# EAGLE design radio-v3.0 (EAGLE 9.2.2)
REVISION: 3.0; SCH_DESC: Dual ISM43340 5GHz radio transciever.; TEAM: RoboCup SSL
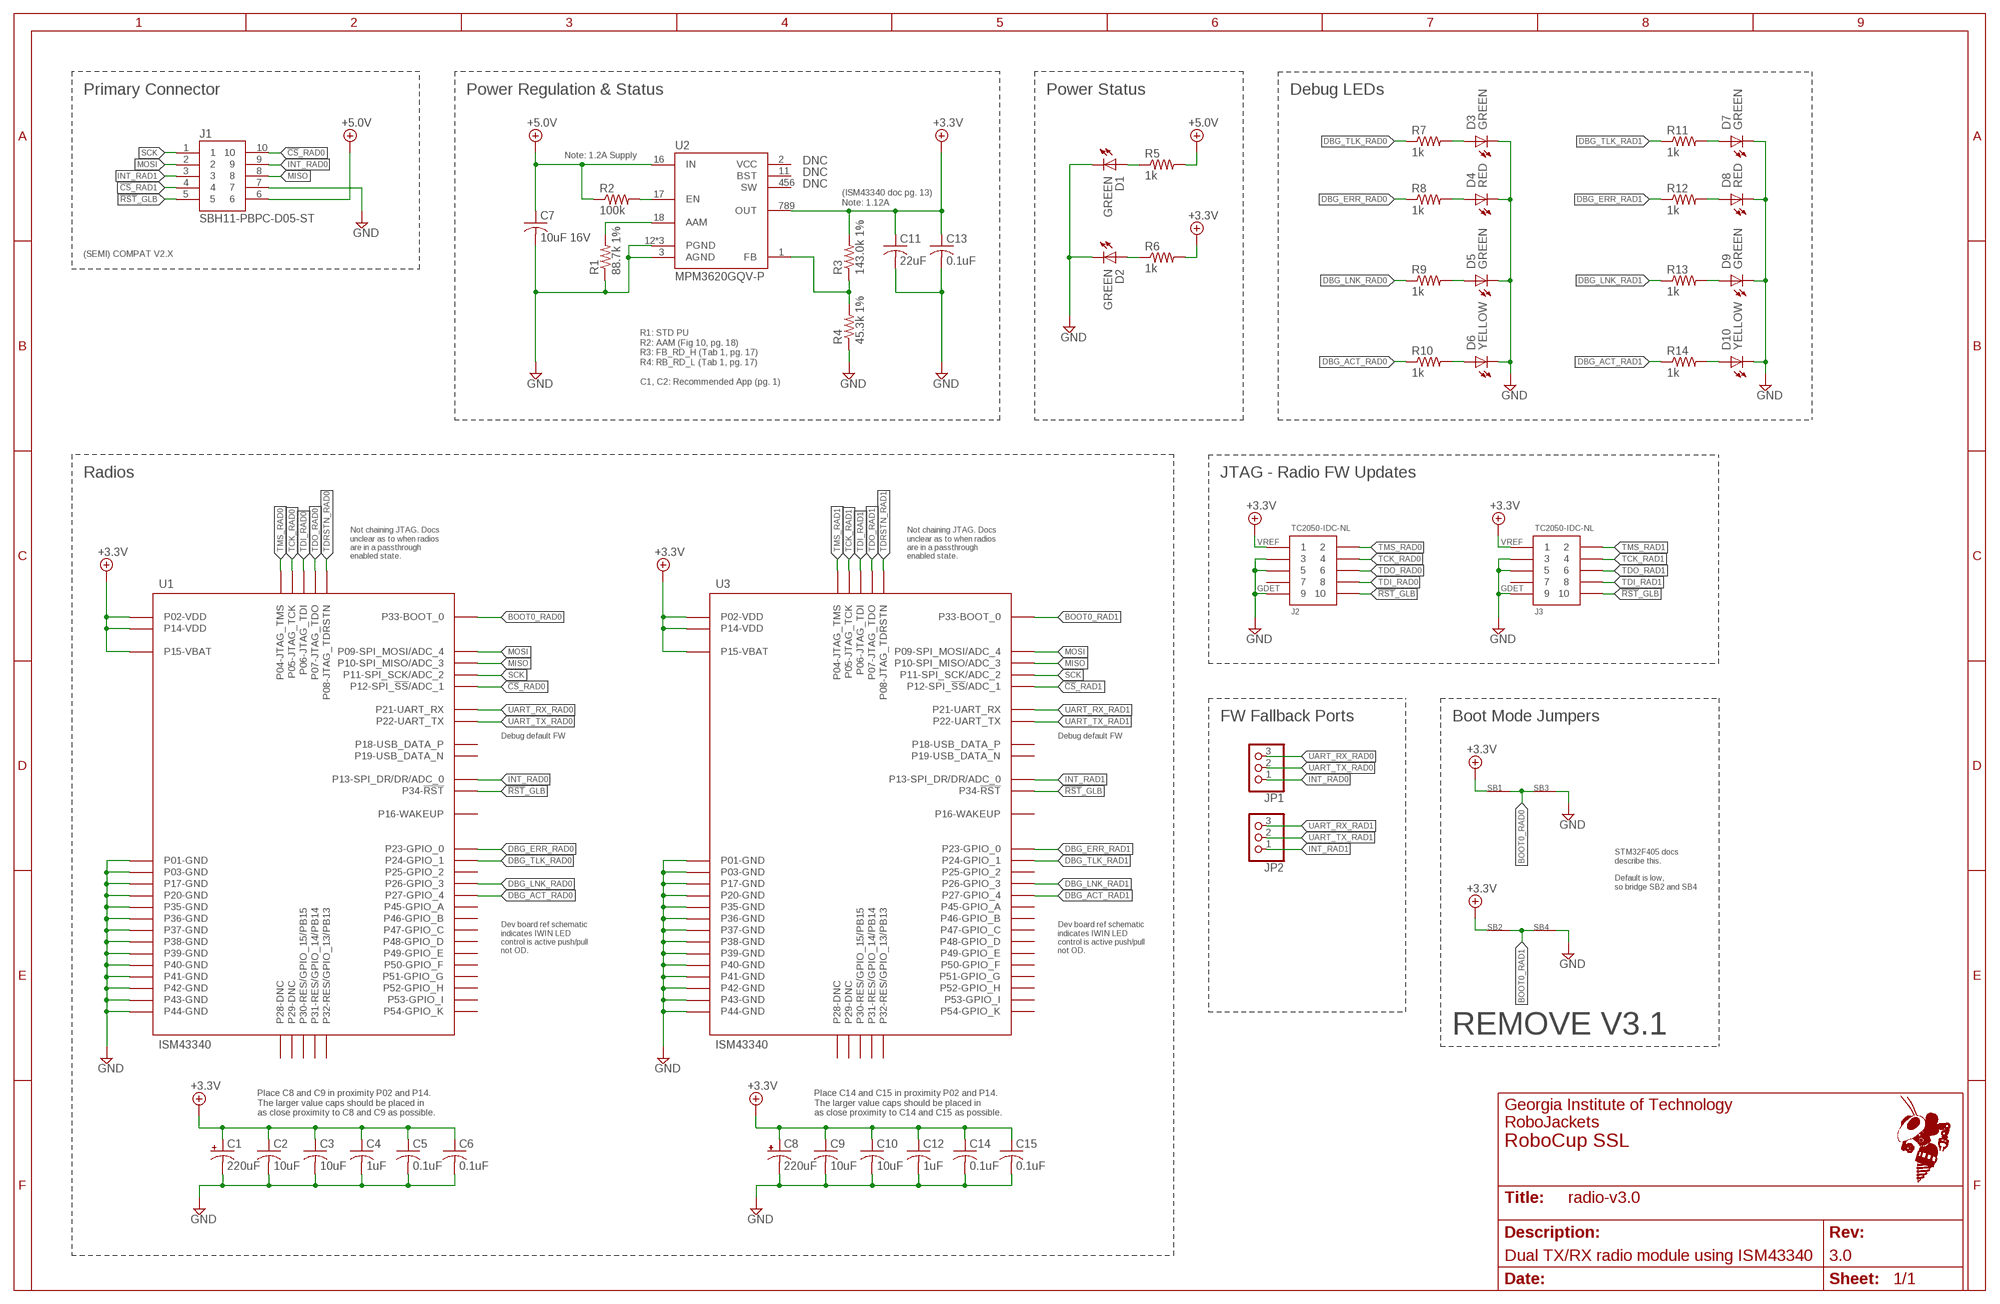
[diagram p0: schematic, sheet 1]
FRAME1 (FRAME_B_L): SCH_DESC: Dual TX/RX radio module using ISM43340

## Parts
C1  220uF  ECA-0JM221  [ECA-0JM221-HGT_HORIZ]
C2  10uF  C-USC1210  [C1210]
C3  10uF  C-USC1210  [C1210]
C4  1uF  C-USC0603  [C0603]
C5  0.1uF  C-USC0603  [C0603]
C6  0.1uF  C-USC0603  [C0603]
C7  10uF 16V  C-USC1210  [C1210]
C8  220uF  ECA-0JM221  [ECA-0JM221-HGT_HORIZ]
C9  10uF  C-USC1210  [C1210]
C10  10uF  C-USC1210  [C1210]
C11  22uF  C-USC1210  [C1210]
C12  1uF  C-USC0603  [C0603]
C13  0.1uF  C-USC0603  [C0603]
C14  0.1uF  C-USC0603  [C0603]
C15  0.1uF  C-USC0603  [C0603]
D1  GREEN  LED-SMD-GREEN  [CHIP-LED0603]
D2  GREEN  LED-SMD-GREEN  [CHIP-LED0603]
D3  GREEN  LED-SMD-GREEN  [CHIP-LED0603]
D4  RED  LED-SMD-RED  [CHIP-LED0603]
D5  GREEN  LED-SMD-GREEN  [CHIP-LED0603]
D6  YELLOW  LED-SMD-YELLOW  [CHIP-LED0603]
D7  GREEN  LED-SMD-GREEN  [CHIP-LED0603]
D8  RED  LED-SMD-RED  [CHIP-LED0603]
D9  GREEN  LED-SMD-GREEN  [CHIP-LED0603]
D10  YELLOW  LED-SMD-YELLOW  [CHIP-LED0603]
J1  SBH11-PBPC-D05-ST  [SFH11-*-D05-ST]
J2  TC2050-IDC-NL  [TC2050-IDC-NL]
J3  TC2050-IDC-NL  [TC2050-IDC-NL]
JP1  PINHD-1X3  [1X03]
JP2  PINHD-1X3  [1X03]
R1  88.7k 1%  R-US_R0603  [R0603]
R2  100k  R-US_R0603  [R0603]
R3  143.0k 1%  R-US_R0603  [R0603]
R4  45.3k 1%  R-US_R0603  [R0603]
R5  1k  R-US_R0603  [R0603]
R6  1k  R-US_R0603  [R0603]
R7  1k  R-US_R0603  [R0603]
R8  1k  R-US_R0603  [R0603]
R9  1k  R-US_R0603  [R0603]
R10  1k  R-US_R0603  [R0603]
R11  1k  R-US_R0603  [R0603]
R12  1k  R-US_R0603  [R0603]
R13  1k  R-US_R0603  [R0603]
R14  1k  R-US_R0603  [R0603]
SB1  SOLDERBRIDGESB0603  [SB0603]
SB2  SOLDERBRIDGESB0603  [SB0603]
SB3  SOLDERBRIDGESB0603  [SB0603]
SB4  SOLDERBRIDGESB0603  [SB0603]
U1  ISM43340  [ISM43340]
U2  MPM3620GQV-P  [MPM3620GQV-P]
U3  ISM43340  [ISM43340]

## Nets
3V3_PWR_IND: D2.A R6.1
5V_PWR_IND: D1.A R5.1
!CS!_RAD0: J1.10 U1.P$12(P12-SPI_!SS!/ADC_1)
!CS!_RAD1: J1.4 U3.P$12(P12-SPI_!SS!/ADC_1)
!RST!_GLB: J1.5 J2.P$10 J3.P$10 U1.P$34(P34-!RST!) U3.P$34(P34-!RST!)
+3.3V: C1.P$1(+) C2.1 C3.1 C4.1 C5.1 C6.1 C8.P$1(+) C9.1 C10.1 C11.1 C12.1 C13.1 C14.1 C15.1 J2.P$1 J3.P$1 R3.2 R6.2 SB1.1 SB2.1 U1.P$2(P02-VDD) U1.P$14(P14-VDD) U1.P$15(P15-VBAT) U2.789(OUT) U3.P$2(P02-VDD) U3.P$14(P14-VDD) U3.P$15(P15-VBAT)
+5.0V: C7.1 J1.6 R2.1 R5.2 U2.16(IN)
AAM: R1.2 U2.18(AAM)
BOOT0_RAD0: SB1.2 SB3.1 U1.P$33(P33-BOOT_0)
BOOT0_RAD1: SB2.2 SB4.1 U3.P$33(P33-BOOT_0)
DBG_ACT_RAD0: R10.1 U1.P$27(P27-GPIO_4)
DBG_ACT_RAD1: R14.1 U3.P$27(P27-GPIO_4)
DBG_ERR_RAD0: R8.1 U1.P$23(P23-GPIO_0)
DBG_ERR_RAD1: R12.1 U3.P$23(P23-GPIO_0)
DBG_LNK_RAD0: R9.1 U1.P$26(P26-GPIO_3)
DBG_LNK_RAD1: R13.1 U3.P$26(P26-GPIO_3)
DBG_TLK_RAD0: R7.1 U1.P$24(P24-GPIO_1)
DBG_TLK_RAD1: R11.1 U3.P$24(P24-GPIO_1)
EN: R2.2 U2.17(EN)
FB: R3.1 R4.2 U2.1(FB)
GND: C1.P$2(-) C2.2 C3.2 C4.2 C5.2 C6.2 C7.2 C8.P$2(-) C9.2 C10.2 C11.2 C12.2 C13.2 C14.2 C15.2 D1.C(K) D2.C(K) D3.C(K) D4.C(K) D5.C(K) D6.C(K) D7.C(K) D8.C(K) D9.C(K) D10.C(K) J1.7 J2.P$3 J2.P$5 J2.P$9 J3.P$3 J3.P$5 J3.P$9 R1.1 R4.1 SB3.2 SB4.2 U1.P$1(P01-GND) U1.P$3(P03-GND) U1.P$17(P17-GND) U1.P$20(P20-GND) U1.P$35(P35-GND) U1.P$36(P36-GND) U1.P$37(P37-GND) U1.P$38(P38-GND) U1.P$39(P39-GND) U1.P$40(P40-GND) U1.P$41(P41-GND) U1.P$42(P42-GND) U1.P$43(P43-GND) U1.P$44(P44-GND) U2.3(AGND) U2.12(PGND) U2.13(PGND) U2.14(PGND) U3.P$1(P01-GND) U3.P$3(P03-GND) U3.P$17(P17-GND) U3.P$20(P20-GND) U3.P$35(P35-GND) U3.P$36(P36-GND) U3.P$37(P37-GND) U3.P$38(P38-GND) U3.P$39(P39-GND) U3.P$40(P40-GND) U3.P$41(P41-GND) U3.P$42(P42-GND) U3.P$43(P43-GND) U3.P$44(P44-GND)
INT_RAD0: J1.9 JP1.1 U1.P$13(P13-SPI_DR/DR/ADC_0)
INT_RAD1: J1.3 JP2.1 U3.P$13(P13-SPI_DR/DR/ADC_0)
MISO: J1.8 U1.P$10(P10-SPI_MISO/ADC_3) U3.P$10(P10-SPI_MISO/ADC_3)
MOSI: J1.2 U1.P$9(P09-SPI_MOSI/ADC_4) U3.P$9(P09-SPI_MOSI/ADC_4)
N$2: D10.A R14.2
N$3: D9.A R13.2
N$4: D8.A R12.2
N$5: D7.A R11.2
N$6: D3.A R7.2
N$7: D4.A R8.2
N$8: D5.A R9.2
N$9: D6.A R10.2
SCK: J1.1 U1.P$11(P11-SPI_SCK/ADC_2) U3.P$11(P11-SPI_SCK/ADC_2)
TCK_RAD0: J2.P$4 U1.P$5(P05-JTAG_TCK)
TCK_RAD1: J3.P$4 U3.P$5(P05-JTAG_TCK)
TDI_RAD0: J2.P$8 U1.P$6(P06-JTAG_TDI)
TDI_RAD1: J3.P$8 U3.P$6(P06-JTAG_TDI)
TDO_RAD0: J2.P$6 U1.P$7(P07-JTAG_TDO)
TDO_RAD1: J3.P$6 U3.P$7(P07-JTAG_TDO)
TDRSTN_RAD0: U1.P$8(P08-JTAG_TDRSTN)
TDRSTN_RAD1: U3.P$8(P08-JTAG_TDRSTN)
TMS_RAD0: J2.P$2 U1.P$4(P04-JTAG_TMS)
TMS_RAD1: J3.P$2 U3.P$4(P04-JTAG_TMS)
UART_RX_RAD0: JP1.3 U1.P$21(P21-UART_RX)
UART_RX_RAD1: JP2.3 U3.P$21(P21-UART_RX)
UART_TX_RAD0: JP1.2 U1.P$22(P22-UART_TX)
UART_TX_RAD1: JP2.2 U3.P$22(P22-UART_TX)
Unconnected: J2.P$7 J3.P$7 U1.P$16(P16-WAKEUP) U1.P$18(P18-USB_DATA_P) U1.P$19(P19-USB_DATA_N) U1.P$25(P25-GPIO_2) U1.P$28(P28-DNC) U1.P$29(P29-DNC) U1.P$30(P30-RES/GPIO_15/PB15) U1.P$31(P31-RES/GPIO_14/PB14) U1.P$32(P32-RES/GPIO_13/PB13) U1.P$45(P45-GPIO_A) U1.P$46(P46-GPIO_B) U1.P$47(P47-GPIO_C) U1.P$48(P48-GPIO_D) U1.P$49(P49-GPIO_E) U1.P$50(P50-GPIO_F) U1.P$51(P51-GPIO_G) U1.P$52(P52-GPIO_H) U1.P$53(P53-GPIO_I) U1.P$54(P54-GPIO_K) U2.2(VCC) U2.11(BST) U2.456(SW) U3.P$16(P16-WAKEUP) U3.P$18(P18-USB_DATA_P) U3.P$19(P19-USB_DATA_N) U3.P$25(P25-GPIO_2) U3.P$28(P28-DNC) U3.P$29(P29-DNC) U3.P$30(P30-RES/GPIO_15/PB15) U3.P$31(P31-RES/GPIO_14/PB14) U3.P$32(P32-RES/GPIO_13/PB13) U3.P$45(P45-GPIO_A) U3.P$46(P46-GPIO_B) U3.P$47(P47-GPIO_C) U3.P$48(P48-GPIO_D) U3.P$49(P49-GPIO_E) U3.P$50(P50-GPIO_F) U3.P$51(P51-GPIO_G) U3.P$52(P52-GPIO_H) U3.P$53(P53-GPIO_I) U3.P$54(P54-GPIO_K)

## Notes on the sheet
- Primary Connector | Power Regulation & Status | Power Status | Debug LEDs
- Note: 1.2A Supply
- DNC
- DNC
- DNC
- (ISM43340 doc pg. 13) 
  Note: 1.12A
- (SEMI) COMPAT V2.X
- R1: STD PU
  R2: AAM (Fig 10, pg. 18)
  R3: FB_RD_H (Tab 1, pg. 17)
  R4: RB_RD_L (Tab 1, pg. 17)
  
  C1, C2: Recommended App (pg. 1)
- Radios | JTAG - Radio FW Updates
- VREF | VREF
- Not chaining JTAG. Docs 
  unclear as to when radios 
  are in a passthrough 
  enabled state.
- Not chaining JTAG. Docs 
  unclear as to when radios 
  are in a passthrough 
  enabled state.
- GDET | GDET
- FW Fallback Ports | Boot Mode Jumpers
- Debug default FW | Debug default FW
- STM32F405 docs 
  describe this. 
  
  Default is low, 
  so bridge SB2 and SB4
- Dev board ref schematic 
  indicates IWIN LED 
  control is active push/pull 
  not OD.
- Dev board ref schematic 
  indicates IWIN LED 
  control is active push/pull 
  not OD.
- REMOVE V3.1
- Place C8 and C9 in proximity P02 and P14.
  The larger value caps should be placed in
  as close proximity to C8 and C9 as possible.
- Place C14 and C15 in proximity P02 and P14.
  The larger value caps should be placed in
  as close proximity to C14 and C15 as possible.

## Library data of the parts
C1 C8 = RoboJackets-Capacitors:ECA-0JM221
C2-C7 C9-C15 = rcl:C-US: CAPACITOR, American symbol; SPICEPREFIX: C
D1-D3 D5 D7 D9 = RoboJackets-LEDs:LED-SMD; DIGIKEY: 160-1446-1-ND; MPN: LTST-C191KGKT
D4 D8 = RoboJackets-LEDs:LED-SMD; DIGIKEY: 160-1447-1-ND; MPN: LTST-C191KRKT
D6 D10 = RoboJackets-LEDs:LED-SMD; DIGIKEY: 160-1448-1-ND; MPN: LTST-C191KSKT
J1 = RoboJackets-Connectors:SBH11-*-D05-?; DIGIKEY: S9194-ND; MPN: SFH11-PBPC-D05-ST-BK
J2 J3 = RoboJackets-Connectors:TC2050-IDC-NL
JP1 JP2 = pinhead:PINHD-1X3: PIN HEADER
R1 R2 R5-R14 = resistor:R-US_: RESISTOR, American symbol
R3 R4 = rcl:R-US_: RESISTOR, American symbol; SPICEPREFIX: R
SB1-SB4 = RoboJackets-Switches:SOLDERBRIDGE
U1 U3 = RoboJackets-RF:ISM43340
U2 = mchair:MPM3620GQV-P

## Board
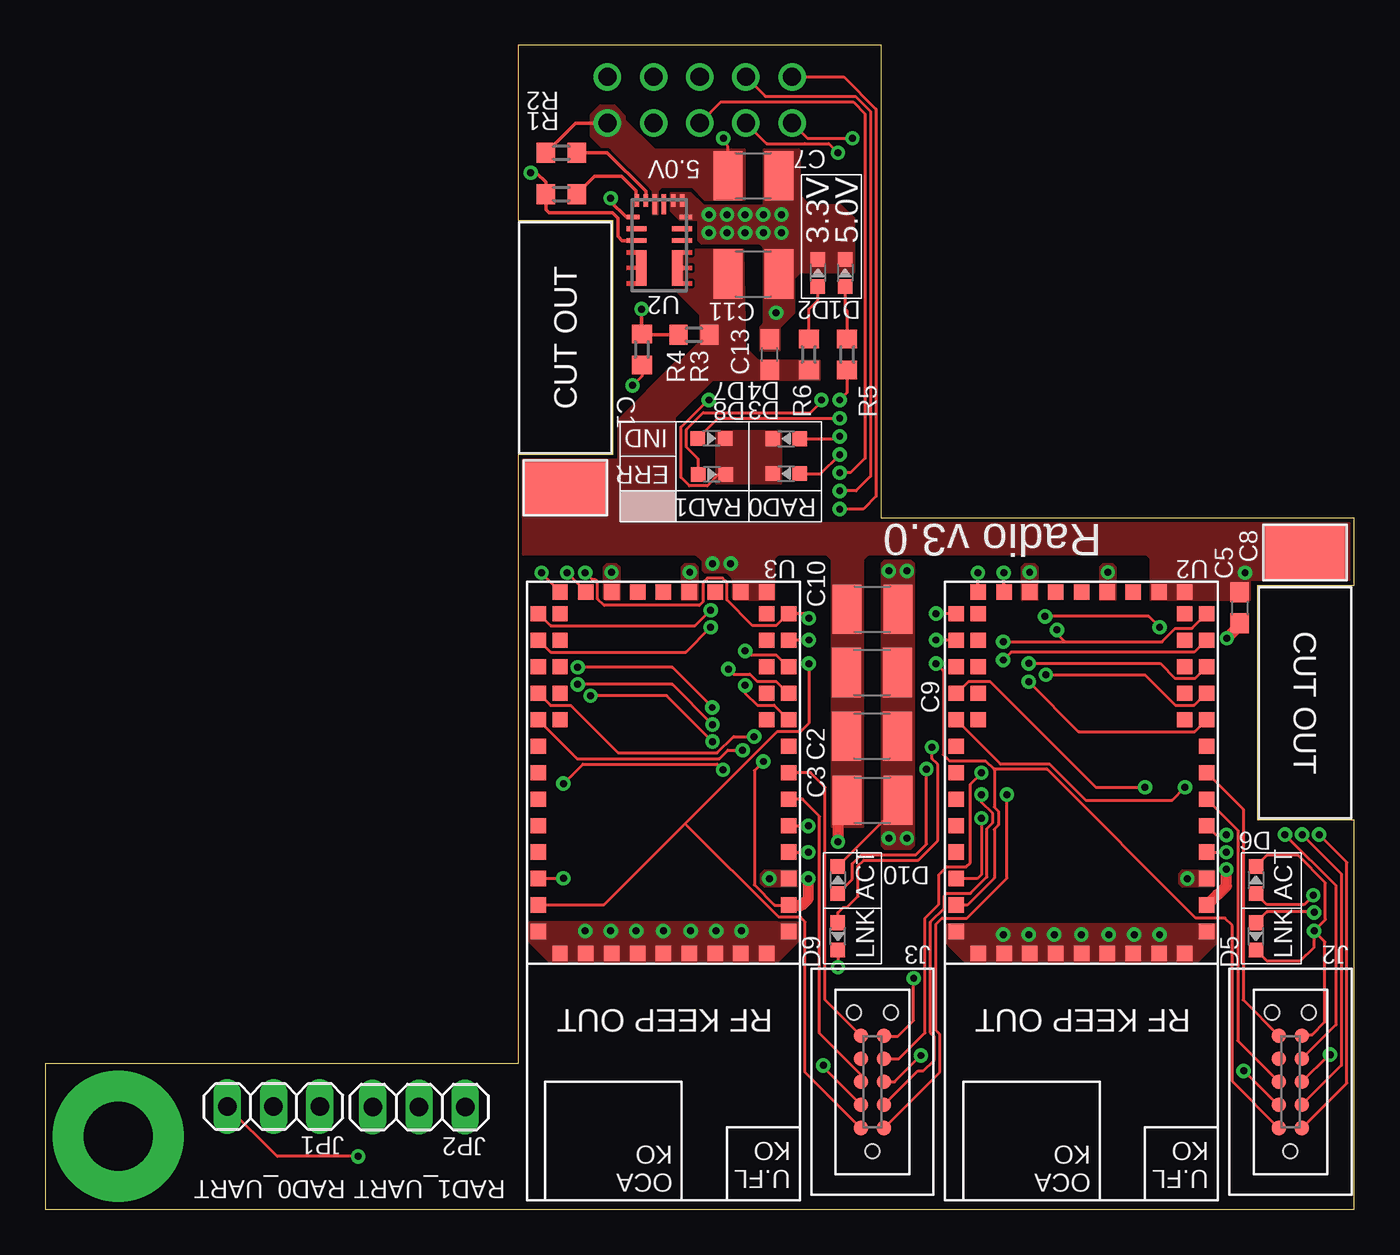
[diagram p1: board, top side]
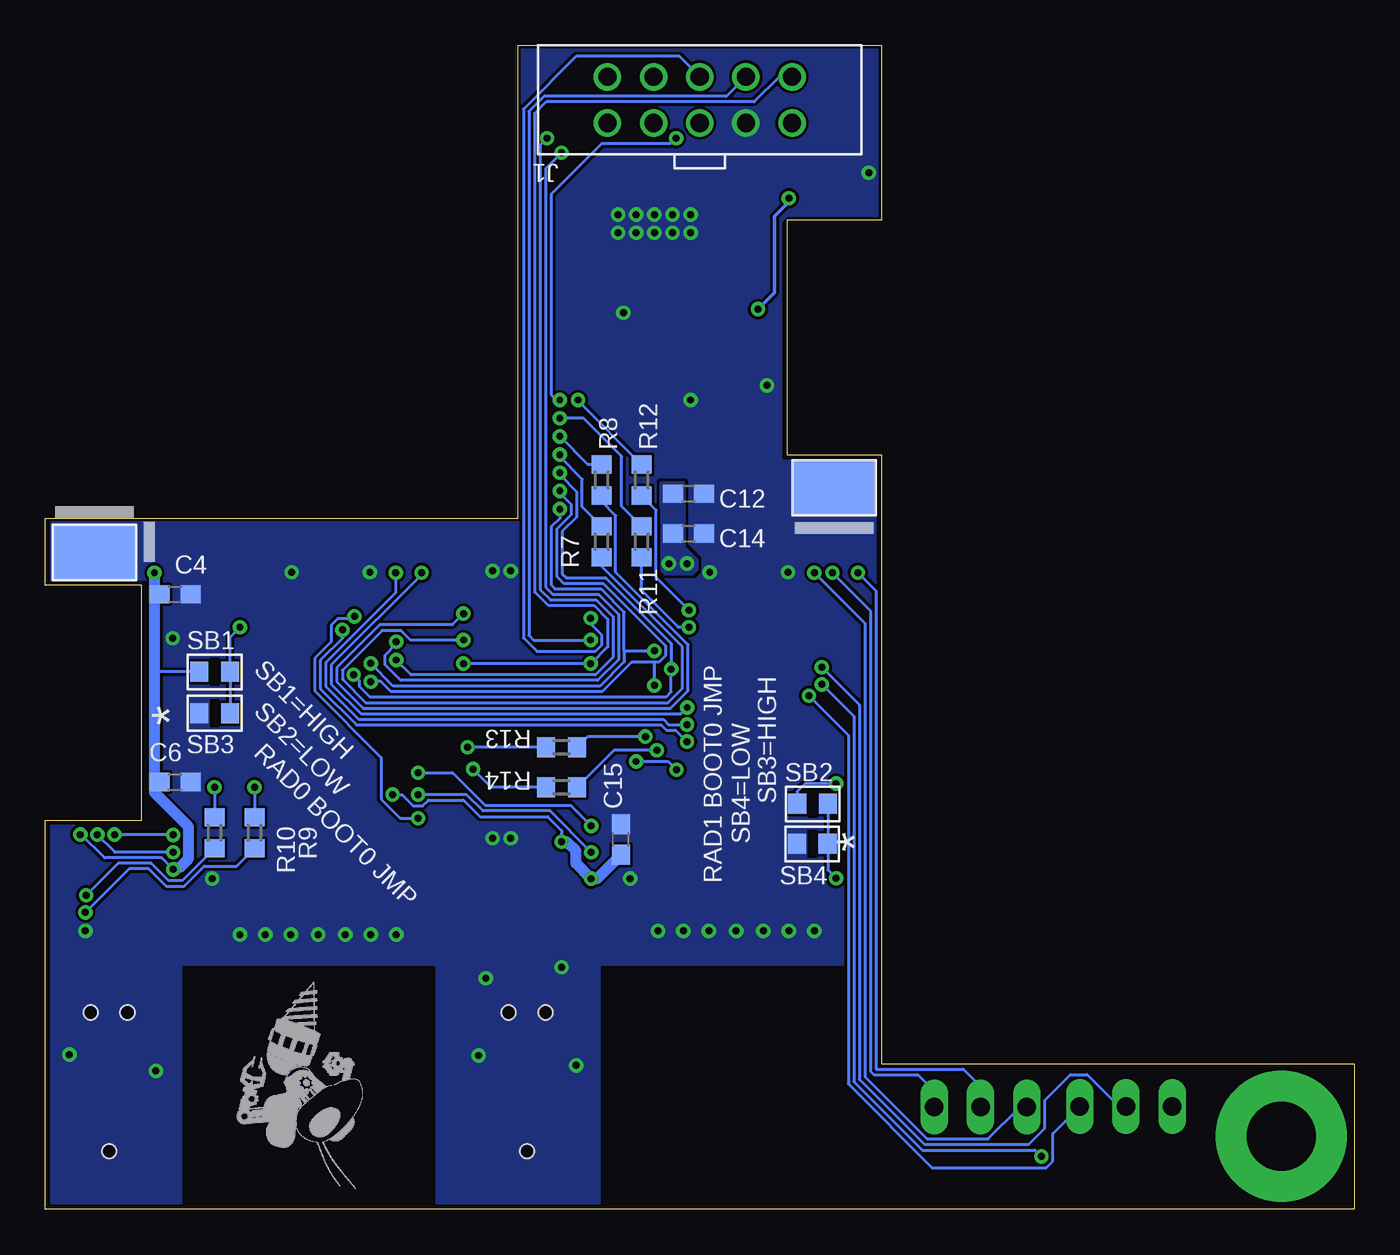
[diagram p2: board, bottom side, seen from below]

Size 72 x 64 mm. Coordinates in mm from the lower left corner, seen from the top.
Outline: 0,0 72,0 72,21.4 66.7,21.4 66.7,34.3 72,34.3 72,38 46,38 46,64 26,64 26,54.4 31.2,54.4 31.2,41.5 26,41.5 26,8 0,8 0,0
Copper layers (1*16): Top 0.0356mm / dielectric 63mil / Bottom 0.0356mm
Design rules "RJ2LayerDRU": minimum track width 6mil, minimum drill 15mil, track to track 6mil, track to pad 6mil, pad to pad 6mil, via to via 6mil, smd to smd 6mil, copper to edge 0mil, drill to drill 6mil, minimum pad ring 10mil, minimum via ring 8mil, stop-mask expansion 4mil, vias tented up to drill 0mil, thermal gap 10mil

### Footprints (pad centres in the part's own frame; a part is rotated, then mirrored left to right if it is on the bottom)
ECA-0JM221-HGT_HORIZ = smd 4.5 x 3: P$1 0,1.905 | smd 4.5 x 3 bottom: P$2 0,1.905
C1210 = smd 1.6 x 2.7: 1 -1.4,0; 2 1.4,0
C0603 = smd 1.1 x 1: 1 -0.85,0; 2 0.85,0
CHIP-LED0603 = smd 0.8 x 0.8: A 0,-0.75; C 0,0.75
SFH11-*-D05-ST = drill 1: 1 -5.08,1.27; 2 -2.54,1.27; 3 0,1.27; 4 2.54,1.27; 5 5.08,1.27; 6 5.08,-1.27; 7 2.54,-1.27; 8 0,-1.27; 9 -2.54,-1.27; 10 -5.08,-1.27
TC2050-IDC-NL = smd 0.787 x 0.787: P$1 -2.54,-0.635; P$2 -1.27,-0.635; P$3 0,-0.635; P$4 1.27,-0.635; P$5 2.54,-0.635; P$6 2.54,0.635; P$7 1.27,0.635; P$8 0,0.635; P$9 -1.27,0.635; P$10 -2.54,0.635 | hole 0.787: -3.81,0; 3.81,1.015; 3.81,-1.015
1X03 = drill 1.016 long: 1 -2.54,0; 2 0,0; 3 2.54,0
R0603 = smd 1 x 1.1: 1 -0.85,0; 2 0.85,0
SB0603 = smd 1 x 1.1: 1 -0.85,0; 2 0.85,0
ISM43340 = smd 0.847 x 0.847: P$1 8.742,6.89; P$2 7.285,6.89; P$3 5.828,6.89; P$4 4.371,6.89; P$5 2.914,6.89; P$6 1.457,6.89; P$7 0,6.89; P$8 -1.457,6.89; P$9 -2.914,6.89; P$10 -4.371,6.89; P$11 -5.828,6.89; P$12 -7.285,6.89; P$13 -8.742,6.89; P$14 -9.948,5.684; P$15 -9.948,4.263; P$16 -9.948,2.842; P$17 -9.948,1.421; P$18 -9.948,0; P$19 -9.948,-1.421; P$20 -9.948,-2.842; P$21 -9.948,-4.263; P$22 -9.948,-5.684; P$23 -8.742,-6.89; P$24 -7.285,-6.89; P$25 -5.828,-6.89; P$26 -4.371,-6.89; P$27 -2.914,-6.89; P$28 -1.457,-6.89; P$29 0,-6.89; P$30 1.457,-6.89; P$31 2.914,-6.89; P$32 4.371,-6.89; P$33 5.828,-6.89; P$34 7.285,-6.89; P$35 8.742,-6.89; P$36 9.948,-5.684; P$37 9.948,-4.263; P$38 9.948,-2.842; P$39 9.948,-1.421; P$40 9.948,0; P$41 9.948,1.421; P$42 9.948,2.842; P$43 9.948,4.263; P$44 9.948,5.684; P$45 -8.742,-5.684; P$46 -7.285,-5.684; P$47 -5.828,-5.684; P$48 -4.371,-5.684; P$49 -2.914,-5.684; P$50 -8.742,5.684; P$51 -7.285,5.684; P$52 -5.828,5.684; P$53 -4.371,5.684; P$54 -2.914,5.684
MPM3620GQV-P = smd 0.7 x 0.25: 1 -1.45,1.55; 12 1.45,1.55 | smd 1.1 x 0.25: 2 -1.25,0.9; 3 -1.25,0.25; 10 1.25,0.25; 11 1.25,0.9 | smd 0.25 x 0.7: 13 1.25,2.45; 14 0.75,2.45; 17 -0.75,2.45; 18 -1.25,2.45 | smd 0.25 x 1.1: 15 0.25,2.25; 16 -0.25,2.25 | smd 0.6 x 1.95: 456 -1,-1.25; 789 1,-1.25

### Placement (x,y rotation side)
C1  28.6,41.58 180 top
C2  45.48,26.02 0 top
C3  45.5,22.49 0 top
C4  64.87,33.81 0 bottom
C5  65.7,33.07 270 top
C6  64.87,23.49 0 bottom
C7  38.95,56.84 0 top
C8  69.3,34.2 0 top
C9  45.48,29.52 0 top
C10  45.5,32.99 0 top
C11  38.95,51.43 0 top
C12  36.62,39.34 0 bottom
C13  39.85,47.01 90 top
C14  36.62,37.16 0 bottom
C15  40.34,20.33 90 bottom
D1  44,51.49 0 top
D2  42.49,51.49 0 top
D3  40.76,40.45 90 top
D4  40.76,42.37 90 top
D5  66.6,15 180 top
D6  66.6,18.1 0 top
D7  36.65,42.39 270 top
D8  36.67,40.41 270 top
D9  43.6,15 180 top
D10  43.6,18.1 0 top
J1  36,61.01 0 bottom
J2  68.5,7 90 top
J3  45.5,7 90 top
JP1  12.55,5.64 180 top
JP2  20.55,5.61 0 top
R1  28.38,55.82 0 top
R2  28.38,58.1 0 top
R3  35.68,48.09 0 top
R4  32.82,47.28 90 top
R5  44.1,47.01 270 top
R6  41.99,47.01 270 top
R7  41.4,36.7 90 bottom
R8  41.4,40.1 90 bottom
R9  60.5,20.7 270 bottom
R10  62.7,20.7 270 bottom
R11  39.2,36.7 90 bottom
R12  39.2,40.1 90 bottom
R13  43.6,25.4 180 bottom
R14  43.6,23.2 180 bottom
SB1  62.69,29.55 0 bottom
SB2  29.79,22.29 0 bottom
SB3  62.69,27.27 180 bottom
SB4  29.81,20.09 180 bottom
U1  57,24 270 top
U2  33.78,53.02 0 top
U3  34,24 270 top
U$1  [ROBOBUZZ_0.6X]  57.2,12.5 180 bottom

### Tracks (layer width: path | path; a pad name or v marks a point on that pad's centre or on a via)
3V3_PWR_IND
  Top 0.152: R6.1 41.99,49.5 42,49.5 42.5,50 D2.A
5V_PWR_IND
  Top 0.152: D1.A 44,49.5 44.1,49.4 R5.1
!CS!_RAD0  (via drill 0.38)
  Top 0.152: J1.10 41.91,58.9 v44.4,58.9 | v52.7,30.2 53.13,30.63 63.2,30.63 63.85,31.29 U1.P$12
  Bottom 0.152: v44.4,58.9 44.79,58.51 44.79,34.08 44.21,33.51 41.69,33.51 40.77,32.58 40.77,30.35 41.74,29.38 51.88,29.38 v52.7,30.2
!CS!_RAD1  (via drill 0.38)
  Top 0.152: v42,31.3 41.98,31.29 U3.P$12
  Bottom 0.152: J1.4 34.53,61.2 44.57,61.2 45.4,60.37 45.4,31.55 45.15,31.3 v42,31.3
!RST!_GLB  (via drill 0.38)
  Top 0.152: U3.P$34 30.71,16.71 35.2,21.2 | 35.2,21.2 40.26,26.26 41.54,26.26 42,26.72 v42,30 | v49,30 49.4,29.6 49.4,25 49.74,24.65 51.73,24.65 52.2,24.18 | J3.P$10 41.8,7.53 41.8,15.8 41.55,16.05 40.35,16.05 35.2,21.2 | U1.P$34 50.72,16.71 52.2,18.2 52.2,20.89 52.43,21.12 52.43,21.88 52.2,22.11 52.2,24.18 | J2.P$10 65.29,7.04 65.29,15.6 64.89,16 63.3,16 55.12,24.18 52.2,24.18
  Bottom 0.152: J1.5 31.62,62.27 33.01,60.9 44.44,60.9 45.09,60.25 45.09,33.95 44.34,33.2 41.82,33.2 41.07,32.45 41.07,30.92 41.99,30 v42,30 v49,30
+3.3V  (via drill 0.38)
  Top 0.152: v52.9,22.8 52.9,18.2 50.7,16 49.33,16 49.01,15.67 49.01,9.83 49.2,9.63 49.2,7.53 J3.P$1 | v28.5,23.4 29.58,24.48 36.96,24.48 v37.28,24.16 | v39.5,24.62 39,24.12 39,17.83 40.12,16.71 U3.P$2 | J2.P$1 71.61,6.93 71.61,19.07 v70.08,20.6
  Top 0.6: U3.P$2 41.62,16.71 41.97,17.07 v41.97,18.18 | C3.1 43.6,21.99 v43.6,20.2 | U1.P$2 64.47,17.3 64.5,17.3 64.97,17.77 v64.97,18.68
  Bottom 0.152: v52.9,22.8 52.38,22.8 51.76,22.18 51.24,22.18 50.92,22.5 49,22.5 48.09,21.59 44.37,21.59 43.6,20.82 v43.6,20.2 | v37.28,24.16 37.72,24.6 39.48,24.6 v39.5,24.62 | v64.97,18.68 65.61,19.32 68.74,19.32 70.02,20.6 v70.08,20.6 | SB1.1 65.95,29.55 66,29.5 | SB2.1 30.64,22.96 30.2,23.4 v28.5,23.4
  Bottom 0.6: v43.6,20.2 43.32,20.2 42.82,19.7 42.82,19.02 v41.97,18.18 41.65,18.18 C15.1 | v64.97,18.68 64.88,18.78 64.62,18.78 64.13,19.27 64.13,21.03 66,22.9 66,23.5 | 66,33.8 66,29.5 66,23.5 | 66,33.8 v66,35 | C6.1 65.99,23.49 66,23.5 | C4.1 66,33.8
  other vias: 37.7,35.5 36.7,35.5
  pour Top (no thermals): 34.4,52.8 38.4,52.8 38.51,47.39 39.2,46.7 42.6,46.7 42.6,45.6 36.69,45.6 34.65,43.56 34.65,37.75 71.75,37.75 71.75,34.6 66.3,34.6 66.3,33.5 60.8,33.5 60.8,35.8 60.6,36 45.25,36 45,35.75 45,21 43.25,21 43.25,35.75 43,36 40.3,36 40.1,35.8 40.1,33.5 37.8,33.5 37.8,34.7 37.5,35 36.27,35 36.15,35.12 36.15,35.65 35.8,36 26.25,36 26.25,41.25 31.5,41.25 31.5,43.4 34.7,46.6 34.9,46.6 36,47.7 36,49.2 34.4,50.8
  pour Bottom (no thermals): 38.2,35.5 38.2,39.9 38.1,40 36.9,40 36.8,39.9 36.8,36.4 36.1,35.7 36.1,35.2 36.4,34.9 37.9,34.9 38.2,35.2
+5.0V  (via drill 0.38)
  Top 0.152: C7.1 37.55,58.45 37.3,58.7 v37.3,58.9 | R5.2 44.1,44.91 v43.7,44.5
  Top 0.2: R2.1 29.16,59.73 J1.6
  Bottom 0.152: v37.3,58.9 37.6,58.6 41.4,58.6 44.18,55.82 44.18,44.8 43.88,44.5 v43.7,44.5
  pour Top (no thermals): 33.4,54.7 33.7,54.7 33.7,56 33.9,56.2 35.6,56.2 36.3,55.5 38.5,55.5 38.5,58.3 33.5,58.3 31.9,59.9 31.9,60.1 31.3,60.7 30.5,60.7 30,60.2 30,59 30.6,58.4 31,58.4 33.4,56
AAM
  Top 0.2: U2.18 32.5,55.5 32.5,56 31.7,56.8 30.21,56.8 R1.2
BOOT0_RAD0  (via drill 0.38)
  Top 0.152: v61.3,32 60.7,32.6 v55,32.6 | v51.5,21.5 51.5,18.4 51.27,18.17 U1.P$33
  Bottom 0.152: SB3.1 SB1.2 61.84,31.46 v61.3,32 | v55,32.6 55.12,32.48 55.91,32.48 56.28,32.11 56.28,31.21 57.19,30.31 57.19,28.5 53.52,24.84 53.52,22.54 52.48,21.5 v51.5,21.5
BOOT0_RAD1  (via drill 0.38)
  Top 0.152: v28.5,18.2 28.47,18.17 U3.P$33
  Bottom 0.152: SB2.2 28.94,20.09 SB4.1 28.96,18.66 v28.5,18.2
DBG_ACT_RAD0  (via drill 0.38)
  Top 0.152: v62.7,23.2 62,22.5 57.23,22.5 55.25,24.48 52.54,24.48 U1.P$27
  Bottom 0.152: v62.7,23.2 R10.1
DBG_ACT_RAD1  (via drill 0.38)
  Top 0.152: v38.36,25.24 37.54,25.24 37.08,24.78 29.24,24.78 U3.P$27
  Top 0.2: 27.14,26.89 U3.P$27
  Bottom 0.152: v38.36,25.24 40.71,25.24 R14.1
DBG_ERR_RAD0  (via drill 0.38)
  Top 0.152: U1.P$23 v49.01,32.74 v49,32.75
  Bottom 0.152: v49,32.75 49.62,32.13 53.61,32.13 55.97,29.77 55.97,29 54.51,27.55 37.61,27.55 36.65,28.51 36.65,31.04 40.62,35.02 40.62,38.15 41.4,38.92 R8.1
DBG_ERR_RAD1  (via drill 0.38)
  Top 0.152: U3.P$23 27.15,32.74 27.8,32.09 35.75,32.09 v36.6,32.94
  Bottom 0.152: v36.6,32.94 38.4,34.74 38.4,38.45 R12.1
DBG_LNK_RAD0  (via drill 0.38)
  Top 0.152: U1.P$26 50.15,28.37 50.8,29.02 51.98,29.02 57.8,23.2 v60.5,23.2
  Bottom 0.152: v60.5,23.2 R9.1
DBG_LNK_RAD1  (via drill 0.38)
  Top 0.152: U3.P$26 27.78,27.7 28.9,27.7 31.51,25.09 36.96,25.09 37.86,25.99 v38.99,25.99
  Top 0.2: 27.14,28.35 U3.P$26
  Bottom 0.152: v38.99,25.99 42.16,25.99 R13.1
DBG_TLK_RAD0  (via drill 0.38)
  Top 0.152: U1.P$24 49.02,31.29 v49,31.3
  Bottom 0.152: v49,31.3 51.92,31.3 52.44,31.82 53.49,31.82 55.66,29.65 55.66,29.13 54.38,27.85 37.73,27.85 36.95,28.64 36.95,30.92 41.4,35.37 R7.1
DBG_TLK_RAD1  (via drill 0.38)
  Top 0.152: U3.P$24 27.15,31.29 27.8,30.63 35.23,30.63 v36.6,32
  Bottom 0.152: v36.6,32 37.17,32 39.2,34.03 R11.1
EN
  Top 0.2: U2.17 33.03,55.97 30.9,58.1 R2.2
FB  (via drill 0.38)
  Top 0.2: U2.1 31.93,54.57 31.1,55.4 v31.1,55.6 | v32.8,49.5 32.8,48.15 R4.2 32.86,48.09 R3.1
  Bottom 0.2: v31.1,55.6 31.1,55.4 31.9,54.6 31.9,50.4 v32.8,49.5
GND  (via drill 0.38)
  Top 0.152: R4.1 32.82,45.82 v32.3,45.3 | D8.C 37.04,40.41 36.41,39.78 35.42,39.78 34.97,40.24 34.97,43.01 36.46,44.5 v36.5,44.5 | J3.P$9 42.8,7.79 v42.8,7.9 | J3.P$3 46.73,7 v48.17,8.45 | C3.2 46.9,22.15 D10.C | D9.C v43.6,13.3 | J2.P$3 70.64,8.5 v70.68,8.5 | J2.P$9 67.8,5.73 v65.92,7.6 | D6.C 67.2,19.45 68.92,19.45 70.42,17.95 70.42,15.92 v69.8,15.3 | D5.C 67.2,13.65 69.05,13.65 69.8,14.4 v69.8,15.3 | J3.P$5 46.17,9.5 46.9,9.5 47.77,10.37 v47.77,12.7 | J2.P$5 69.19,9.6 69.7,9.6 70.4,10.3 70.4,14.7 v69.8,15.3
  Top 0.2: U2.3 31.73,53.27 31.5,53.5 31.5,54.5 31.2,54.8 27.7,54.8 27.53,54.97 R1.1 27.53,56.47 27,57 v26.7,57
  Top 0.6: C5.2 65.7,32.1 v65,31.4
  other vias: 36.5,54.7 37.5,54.7 38.5,54.7 40.5,54.7 40.5,53.7 39.5,53.7 38.5,53.7 37.5,53.7 36.5,53.7 39.5,54.7 54.15,35.02 35.45,35.02 31.15,35.02 58.45,35.02 38.3,15.3 36.9,15.3 35.5,15.3 34,15.3 32.5,15.3 31.1,15.3 29.7,15.3 61.3,15.1 59.9,15.1 58.5,15.1 57,15.1 55.5,15.1 54.1,15.1 52.7,15.1 39.83,18.18 46.4,20.4 47.4,20.4 46.4,35.1 47.4,35.1 62.83,18.18 40.2,49.3
  pour Top (no thermals): 34.4,55.9 34.4,54.9 34.9,54.4 35.9,54.4 35.9,53.3 36.1,53.1 39.3,53.1 39.5,52.9 39.5,48.7 39.3,48.5 39.3,47.2 40.4,47.2 40.4,48.5 41.2,49.3 41.2,51.2 41.5,51.5 44.5,51.5 44.5,54.5 43.75,55.25 42,55.25 41.5,55.75 41.5,58.25 41.45,58.3 39.5,58.3 39.5,55.2 36.2,55.2 35.5,55.9
  pour Bottom (rank 2, no thermals): 26.2,63.8 45.8,63.8 45.8,37.8 71.7,37.8 71.7,34.6 66.3,34.6 66.3,21.1 71.7,21.1 71.7,0.3 64.5,0.3 64.5,13.4 50.5,13.4 50.5,0.3 41.5,0.3 41.5,13.4 27.5,13.4 27.5,0.3 0.3,0.3 0.3,7.7 26.3,7.7 26.3,41.2 31.5,41.2 31.5,54.3 31.2,54.6 26.2,54.6
  pour Top (no thermals): 36.9,42.8 40.5,42.8 40.5,39.9 36.9,39.9
  pour Top (no thermals): 53.7,33.5 54.6,33.5 54.6,35.3 54.4,35.5 53.9,35.5 53.7,35.3
  pour Top (no thermals): 35,33.5 35.9,33.5 35.9,35.3 35.7,35.5 35.2,35.5 35,35.3
  pour Top (no thermals): 30.7,33.5 31.6,33.5 31.6,35.3 31.4,35.5 30.9,35.5 30.7,35.3
  pour Top (no thermals): 58,33.5 58.9,33.5 58.9,35.3 58.7,35.5 58.2,35.5 58,35.3
  pour Top (no thermals): 26.6,15.8 26.6,14.7 27.7,13.6 40.3,13.6 41.4,14.7 41.4,15.7 41.4,15.8
  pour Top (no thermals): 49.6,15.7 49.6,14.6 50.7,13.5 63.3,13.5 64.4,14.6 64.4,15.6 64.4,15.7
  pour Top (no thermals): 41.35,17.73 41.35,18.62 39.55,18.62 39.35,18.43 39.35,17.93 39.55,17.73
  pour Top (no thermals): 46,35.5 46.2,35.7 47.6,35.7 47.8,35.5 47.8,20 47.6,19.8 46.2,19.8 46,20
  pour Top (no thermals): 64.35,17.73 64.35,18.62 62.55,18.62 62.35,18.43 62.35,17.93 62.55,17.73
INT_RAD0  (via drill 0.38)
  Top 0.152: J1.9 39.67,58.6 41.78,58.6 41.79,58.59 43.1,58.59 v43.6,58.1 | U1.P$13 63.09,31.94 62.17,31.94 61.43,31.2 56.1,31.2 | v52.7,31.2 56.1,31.2 | 56.1,31.2 55.66,31.64 v55.66,31.86 | v36.7,25.71 34.17,28.24 v29.99,28.24
  Bottom 0.152: v43.6,58.1 44.48,57.22 44.48,34.2 44.09,33.81 41.57,33.81 40.46,32.7 40.46,30.23 41.62,29.07 52.45,29.07 53.32,29.94 53.32,30.46 52.7,31.08 v52.7,31.2 | v55.66,31.86 55.66,31.41 56.88,30.18 56.88,28.62 54.89,26.63 38.2,26.63 38.13,26.63 37.84,26.34 37.34,26.34 v36.7,25.71 | v29.99,28.24 27.82,26.07 27.82,6.89 23.21,2.28 16.94,2.28 16.58,2.64 16.58,4.15 JP1.1
INT_RAD1  (via drill 0.38)
  Top 0.152: v42,32.5 41.76,32.74 U3.P$13 40.85,32.74 40.2,32.09 38.91,32.09 37.49,33.51 37.49,34.47 37.26,34.7 36.4,34.7 36.4,34.68 36.19,34.47 36.19,33.41 35.98,33.2 30.74,33.2 30.39,33.55 30.39,34.47 30.25,34.6 30.1,34.6 v29.7,35
  Bottom 0.152: J1.3 37.12,63.4 42.8,63.4 45.7,60.5 45.7,31.42 44.95,30.68 41.74,30.68 41.38,31.04 41.38,31.56 42,32.18 v42,32.5 | v29.7,35 26.91,32.21 26.91,7.27 23.5,3.86 20.14,3.86 18.39,5.61 JP2.1
MISO  (via drill 0.38)
  Top 0.152: J1.8 37.16,60.9 39.48,60.9 39.49,60.9 44.44,60.9 45.09,60.24 45.09,49.7 45.09,41.3 44.3,40.5 v43.7,40.5 | 41.23,28.37 U3.P$10 40.85,28.37 40.2,29.02 39.16,29.02 38.76,29.42 37.85,29.42 v37.57,29.7 | v55.04,29.39 60.5,29.39 62.17,27.72 63.2,27.72 63.85,28.37 U1.P$10
  Bottom 0.152: v43.7,40.5 43.7,40.38 42.77,39.45 42.77,38.06 43.57,37.27 43.57,34.93 43.36,34.72 41.19,34.72 37.57,31.11 v37.57,29.7 37.57,28.45 37.86,28.16 54.14,28.16 54.72,28.74 54.72,29.07 v55.04,29.39
MOSI  (via drill 0.38)
  Top 0.152: J1.2 39.62,61.2 44.57,61.2 45.4,60.37 45.4,40.3 44.6,39.5 v43.7,39.5 | U3.P$9 40.09,27.72 39.17,27.72 38.5,28.39 v38.5,28.8 | v54.1,29 56.84,26.26 63.24,26.26 U1.P$9
  Bottom 0.152: v43.7,39.5 43.7,39.38 43.08,38.76 43.08,38.19 43.87,37.4 43.87,34.8 43.49,34.42 41.31,34.42 37.88,30.98 37.88,30.44 38.24,30.08 38.5,30.08 | 38.5,30.08 39.75,30.08 41.36,28.46 52.98,28.46 53.56,29.04 54.06,29.04 v54.1,29 | v38.5,28.8 38.5,30.08
N$1  (via drill 3.8 pad 7.2)
  other vias: 4,4
N$2  (via drill 0.38)
  Top 0.152: D10.A 44.4,18.15 44.4,19 44.9,19.5 47.9,19.5 48.47,20.07 v48.47,24.2
  Bottom 0.152: R14.2 47.47,23.2 v48.47,24.2
N$3  (via drill 0.38)
  Top 0.152: D9.A 43.6,16.3 43.9,16.6 44.1,16.6 44.7,17.2 44.7,18.87 45.03,19.2 48.03,19.2 49.09,20.26 49.09,24.46 48.78,24.77 v48.78,25.4
  Bottom 0.152: R13.2 v48.78,25.4
N$4  (via drill 0.38)
  Top 0.152: D8.A 35.92,41.25 35.27,41.9 35.27,42.88 36.19,43.8 42.1,43.8 42.7,44.41 v42.7,44.5
  Bottom 0.152: R12.2 42.7,44.45 v42.7,44.5
N$5  (via drill 0.38)
  Top 0.152: D7.A 37.01,43.5 v43.7,43.5
  Bottom 0.152: R11.2 40.3,38.65 40.3,41.4 42.4,43.5 v43.7,43.5
N$6  (via drill 0.38)
  Top 0.152: D3.A 42.65,40.45 v43.7,41.5
  Bottom 0.152: R7.2 42.47,38.62 42.47,40.15 43.7,41.38 v43.7,41.5
N$7  (via drill 0.38)
  Top 0.152: D4.A 43.57,42.37 v43.7,42.5
  Bottom 0.152: R8.2 42.15,40.95 v43.7,42.5
N$8  (via drill 0.38)
  Top 0.152: D5.A 67.2,16.35 69.77,16.35 v69.8,16.32
  Bottom 0.152: v69.8,16.32 v69.79,16.32 67.4,18.71 66.31,18.71 65.36,17.76 64.36,17.76 63.26,18.86 61.49,18.86 R9.2
N$9  (via drill 0.38)
  Top 0.152: D6.A 67.2,16.75 69.25,16.75 v69.76,17.26
  Bottom 0.152: R10.2 64.49,18.06 65.23,18.06 66.18,19.02 68,19.02 v69.76,17.26
SCK  (via drill 0.38)
  Top 0.152: J1.1 43.92,62.27 45.7,60.49 45.7,39.2 45,38.5 v43.7,38.5 | U3.P$11 40.85,29.83 40.2,30.48 38.72,30.48 v38.5,30.7 | v54.1,30.01 61.33,30.01 62.17,29.18 63.24,29.18 U1.P$11
  Bottom 0.152: v43.7,38.5 43.7,38 44.18,37.52 44.18,34.33 43.96,34.11 41.44,34.11 40.16,32.83 40.16,30.7 | 40.16,30.7 40.16,30.1 41.49,28.77 52.86,28.77 v54.1,30.01 | 40.16,30.7 v38.5,30.7
TCK_RAD0  (via drill 0.38)
  Top 0.152: U1.P$5 64.4,20.58 v64.97,20.58 | v68.2,20.6 71,17.8 71,10.13 J2.P$4
  Bottom 0.152: v64.97,20.58 68.18,20.58 v68.2,20.6
TCK_RAD1  (via drill 0.38)
  Top 0.152: J3.P$4 46.97,8.27 48.39,9.69 48.39,16 49.15,16.76 49.15,18.39 49.59,18.82 50.67,18.82 50.88,19.04 50.88,23.36 51.5,23.98 v51.5,24 | U3.P$5 41.96,21.09 v41.97,21.07
  Bottom 0.152: v41.97,21.07 43.1,22.2 47.8,22.2 49.6,24 v51.5,24
TDI_RAD0
  Top 0.152: U1.P$6 65.59,20.84 65.59,9.27 J2.P$8
TDI_RAD1
  Top 0.152: J3.P$8 44.87,7.39 42.59,9.66 42.59,21.61 41.66,22.54 U3.P$6
TDO_RAD0
  Top 0.152: U1.P$7 65.9,21.99 65.9,11.51 J2.P$6
TDO_RAD1
  Top 0.152: J3.P$6 42.9,11.51 42.9,23.2 42.1,24 U3.P$7
TMS_RAD0  (via drill 0.38)
  Top 0.152: U1.P$4 v64.97,19.63 v64.97,19.62 | v69.14,20.6 71.31,18.43 71.31,7.9 J2.P$2
  Bottom 0.152: v64.97,19.62 68.17,19.62 v69.14,20.6
TMS_RAD1  (via drill 0.38)
  Top 0.152: U3.P$4 v41.97,19.63 v41.97,19.62 | J3.P$2 48.01,7.6 48.3,7.6 48.9,8.2 48.9,9.5 48.7,9.7 48.7,15.79 49.46,16.56 49.46,17.23 49.59,17.37 50.9,17.37 51.8,18.27 51.8,20.93 52.12,21.24 52.12,21.76 51.5,22.38 v51.5,22.8
  Bottom 0.152: v41.97,19.62 44.24,21.89 47.93,21.89 48.83,22.8 v51.5,22.8
UART_RX_RAD0  (via drill 0.38)
  Top 0.152: U1.P$21 52.74,34.99 v52.73,35 | v36.7,26.65 34.49,28.86 v29.29,28.86 | v17.2,2.9 12.75,2.9 JP1.3
  Bottom 0.152: v52.73,35 52.73,33.91 56.58,30.05 56.58,28.75 54.76,26.94 38,26.94 37.71,26.65 v36.7,26.65 | v29.29,28.86 27.52,27.09 27.52,7.01 23.75,3.25 17.55,3.25 v17.2,2.9
UART_RX_RAD1  (via drill 0.38)
  Top 0.152: U3.P$21 29.74,33.96 v28.7,35
  Bottom 0.152: v28.7,35 26.61,32.91 26.61,7.57 26.43,7.39 24,7.39 23.09,6.49 JP2.3
UART_TX_RAD0  (via drill 0.38)
  Top 0.152: U1.P$22 51.3,33.97 v51.3,35 | v36.69,27.59 34.49,29.79 v29.3,29.79 v29.29,29.8
  Bottom 0.152: v51.3,35 51.3,34.9 56.27,29.93 56.27,28.88 54.64,27.24 37.03,27.24 v36.69,27.59 | v29.29,29.8 27.21,27.73 27.21,7.14 23.63,3.55 17.9,3.55 17.02,4.44 17.02,5.98 15.61,7.39 14.68,7.39 12.93,5.64 JP1.2
UART_TX_RAD1  (via drill 0.38)
  Top 0.152: U3.P$22 27.3,34.97 v27.3,35
  Bottom 0.152: v27.3,35 26.3,34 26.3,7.7 21.5,7.7 20.55,6.75 JP2.2

### Text on the board
tPlace: 5.0V | 3.3V | 5.0V | IND | ERR | RAD1 | RAD0 | Radio v3.0 | U3 | U2 | ACT | ACT | LNK | J3 | LNK | J2 | RAD0_UART | RAD1_UART
bPlace: SB1=HIGH | SB2=LOW | * | RAD0 BOOT0 JMP | SB3=HIGH | * | SB4=LOW | RAD1 BOOT0 JMP